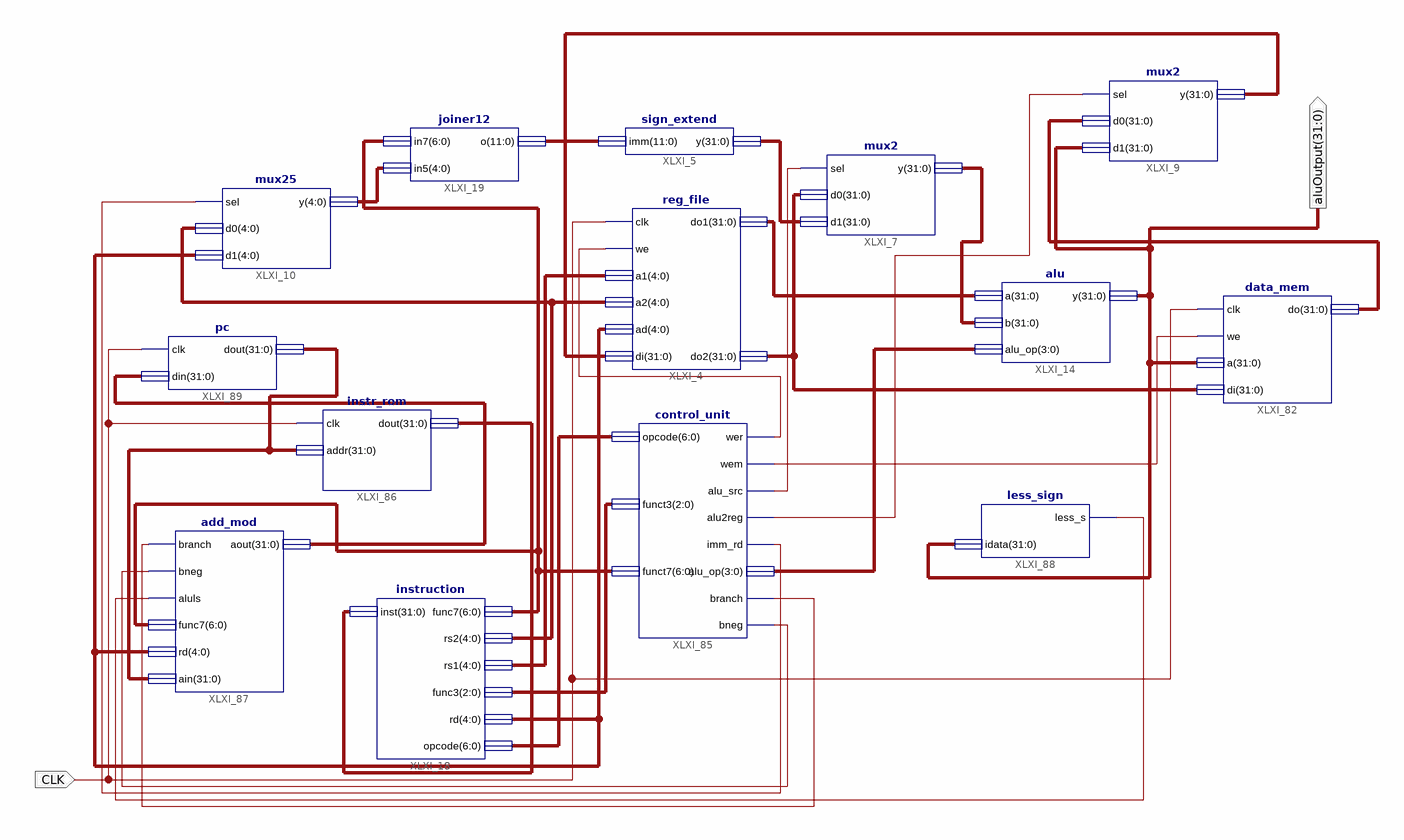
[diagram p0: schematic sheet 1]
// Xilinx ISE schematic main.sch (spartan3e) as structural Verilog: 14 symbols, 2 ports
module main (
  input  CLK,
  output [31:0] aluOutput
);

  wire XLXN_4, XLXN_10, XLXN_15, XLXN_22, XLXN_24, XLXN_242, XLXN_244, XLXN_245;
  wire [2:0] XLXN_32;
  wire [3:0] XLXN_7;
  wire [4:0] XLXN_25, XLXN_33, XLXN_206, XLXN_227;
  wire [6:0] XLXN_28, XLXN_220;
  wire [11:0] XLXN_31;
  wire [31:0] XLXN_17, XLXN_204, XLXN_230, XLXN_235, XLXN_237, XLXN_238, XLXN_240, XLXN_248, XLXN_249;

  reg_file XLXI_4 (
    .clk(CLK), .we(XLXN_22), .a1(XLXN_206), .a2(XLXN_33), .ad(XLXN_227), .di(XLXN_17), .do1(XLXN_238),
    .do2(XLXN_235));
  sign_extend XLXI_5 (.imm(XLXN_31), .y(XLXN_204));
  mux2 XLXI_7 (.sel(XLXN_4), .d0(XLXN_235), .d1(XLXN_204), .y(XLXN_237));
  mux2 XLXI_9 (.sel(XLXN_15), .d0(XLXN_230), .d1(aluOutput), .y(XLXN_17));
  alu XLXI_14 (.a(XLXN_238), .b(XLXN_237), .alu_op(XLXN_7), .y(aluOutput));
  joiner12 XLXI_19 (.in7(XLXN_220), .in5(XLXN_25), .o(XLXN_31));
  mux25 XLXI_10 (.sel(XLXN_24), .d0(XLXN_33), .d1(XLXN_227), .y(XLXN_25));
  instruction XLXI_18 (
    .inst(XLXN_240), .func7(XLXN_220), .rs2(XLXN_33), .rs1(XLXN_206), .func3(XLXN_32), .rd(XLXN_227),
    .opcode(XLXN_28));
  data_mem XLXI_82 (.clk(CLK), .we(XLXN_10), .a(aluOutput), .di(XLXN_235), .\do (XLXN_230));
  control_unit XLXI_85 (
    .opcode(XLXN_28), .funct3(XLXN_32), .funct7(XLXN_220), .wer(XLXN_22), .wem(XLXN_10), .alu_src(XLXN_4),
    .alu2reg(XLXN_15), .imm_rd(XLXN_24), .branch(XLXN_244), .bneg(XLXN_242), .alu_op(XLXN_7));
  instr_rom XLXI_86 (.clk(CLK), .addr(XLXN_248), .dout(XLXN_240));
  add_mod XLXI_87 (
    .branch(XLXN_244), .bneg(XLXN_242), .aluls(XLXN_245), .func7(XLXN_220), .rd(XLXN_227), .ain(XLXN_248),
    .aout(XLXN_249));
  less_sign XLXI_88 (.less_s(XLXN_245), .idata(aluOutput));
  pc XLXI_89 (.clk(CLK), .din(XLXN_249), .dout(XLXN_248));
endmodule
